# Altium project SecondaryPCB-airbnb.PrjPcb
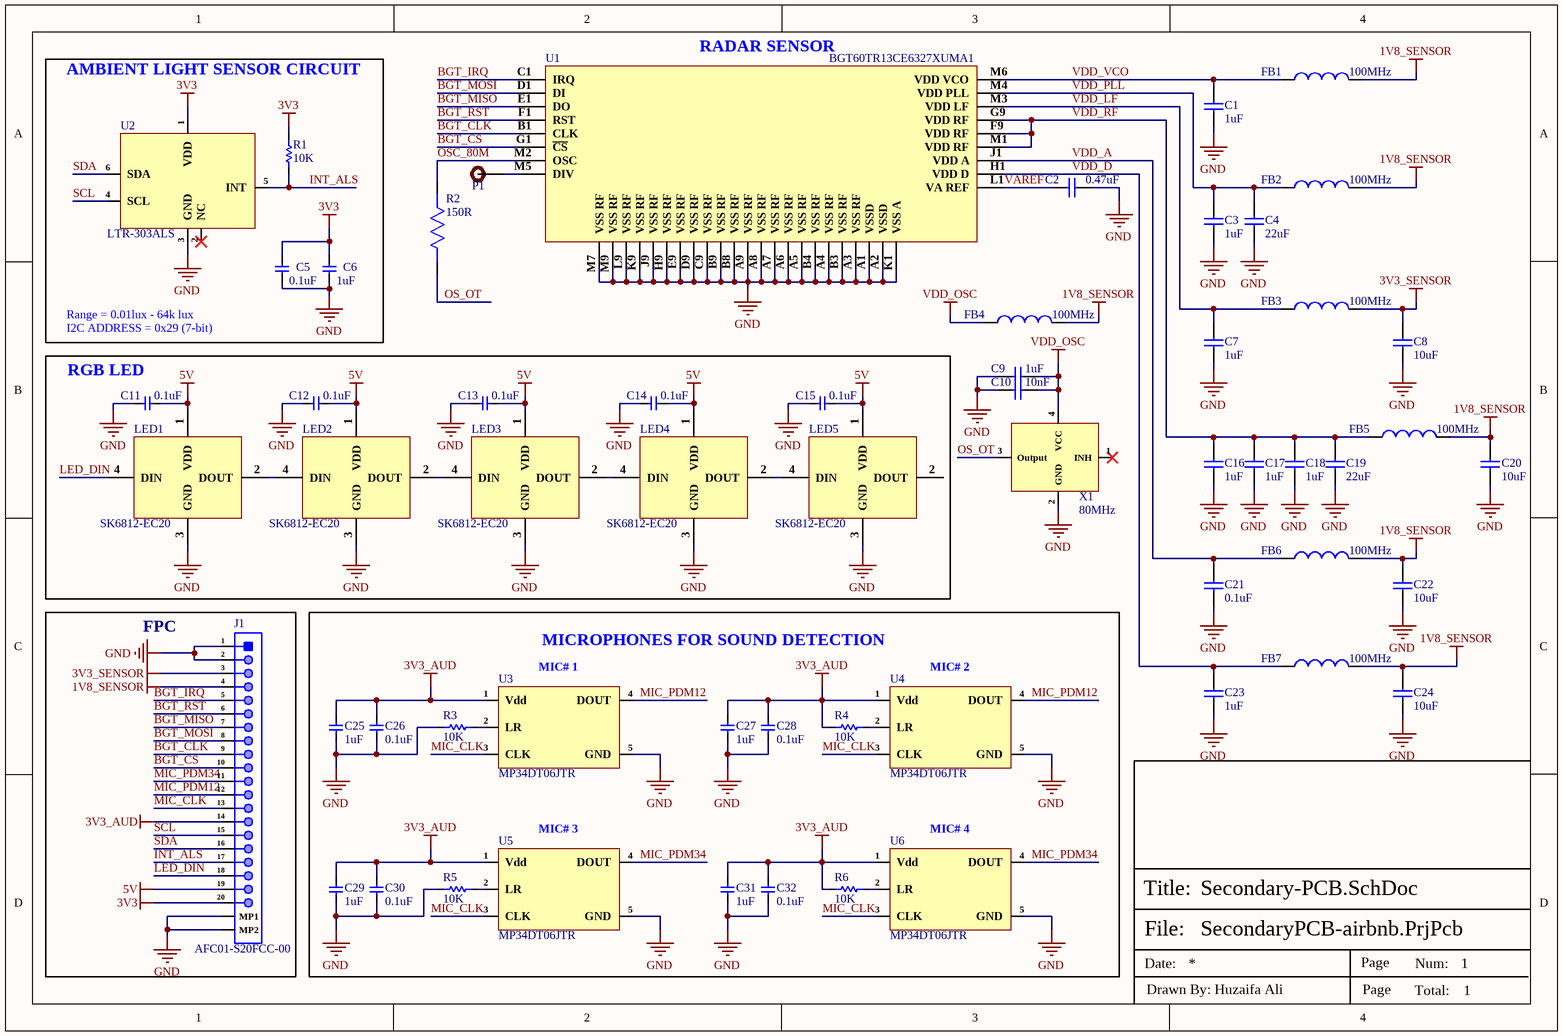
[diagram p0: Secondary-PCB.SchDoc]
1 sheet, 59 parts. Net scope: global (net labels, ports and power ports of the same name join across sheets).
Board file: Secondary-PCB.PcbDoc

## Sheet Secondary-PCB.SchDoc
size A4; SheetNumber: 1; SheetTotal: 1

### Parts
C1  1uF  [Cap-0402]
C2  0.47uF  [Cap-0402]
C3  1uF  [Cap-0402]
C4  22uF  [Cap-0603]
C5  0.1uF  [Cap-0402]
C6  1uF  [Cap-0402]
C7  1uF  [Cap-0402]
C8  10uF  [Cap-0402]
C9  1uF  [Cap-0402]
C10  10nF  [Cap-0402]
C11  0.1uF  [Cap-0402]
C12  0.1uF  [Cap-0402]
C13  0.1uF  [Cap-0402]
C14  0.1uF  [Cap-0402]
C15  0.1uF  [Cap-0402]
C16  1uF  [Cap-0402]
C17  1uF  [Cap-0402]
C18  1uF  [Cap-0402]
C19  22uF  [Cap-0603]
C20  10uF  [Cap-0402]
C21  0.1uF  [Cap-0402]
C22  10uF  [Cap-0402]
C23  1uF  [Cap-0402]
C24  10uF  [Cap-0402]
C25  1uF  [Cap-0402]
C26  0.1uF  [Cap-0402]
C27  1uF  [Cap-0402]
C28  0.1uF  [Cap-0402]
C29  1uF  [Cap-0402]
C30  0.1uF  [Cap-0402]
C31  1uF  [Cap-0402]
C32  0.1uF  [Cap-0402]
FB1  100MHz  [IND-0402]
FB2  100MHz  [IND-0402]
FB3  100MHz  [IND-0402]
FB4  100MHz  [IND-0402]
FB5  100MHz  [IND-0402]
FB6  100MHz  [IND-0402]
FB7  100MHz  [IND-0402]
J1  AFC01-S20FCC-00  [AFC01-S20FCC-00]
LED1  SK6812-EC20  [SK6812-EC20]
LED2  SK6812-EC20  [SK6812-EC20]
LED3  SK6812-EC20  [SK6812-EC20]
LED4  SK6812-EC20  [SK6812-EC20]
LED5  SK6812-EC20  [SK6812-EC20]
P1  TEST POINT  [Test-point]  (value not drawn)
R1  10K  [Res-0603]
R2  150R  [Res-0402]
R3  10K  [Res-0603]
R4  10K  [Res-0603]
R5  10K  [Res-0603]
R6  10K  [Res-0603]
U1  BGT60TR13CE6327XUMA1  [pg-vf2bga-40]
U2  LTR-303ALS  [6-Pin ChipLED]
U3  MP34DT06JTR  [MP34DT06JTR]
U4  MP34DT06JTR  [MP34DT06JTR]
U5  MP34DT06JTR  [MP34DT06JTR]
U6  MP34DT06JTR  [MP34DT06JTR]
X1  80MHz  [KC2016K]

### Blocks framed on the sheet
AMBIENT LIGHT SENSOR CIRCUIT: C5 C6 R1 U2
RGB LED: C11-C15 LED1-LED5
FPC: J1
MICROPHONES FOR SOUND DETECTION: C25-C32 R3-R6 U3-U6

### Nets
1V8_SENSOR: C20.2 C22.2 C24.2 FB1.2 FB2.2 FB4.2 FB5.2 FB6.2 FB7.2 J1.4
3V3: C5.2 C6.2 J1.20 R1.1 U2.1(VDD)
3V3_AUD: C25.2 C26.2 C27.2 C28.2 C29.2 C30.2 C31.2 C32.2 J1.14 R4.2 R6.2 U3.1(Vdd) U4.1(Vdd) U5.1(Vdd) U6.1(Vdd)
3V3_SENSOR: C8.2 FB3.2 J1.3
5V: C11.1 C12.1 C13.1 C14.1 C15.1 J1.19 LED1.1(VDD) LED2.1(VDD) LED3.1(VDD) LED4.1(VDD) LED5.1(VDD)
GND: C1.1 C2.2 C3.1 C4.1 C5.1 C6.1 C7.1 C8.1 C9.2 C10.2 C11.2 C12.2 C13.2 C14.2 C15.2 C16.1 C17.1 C18.1 C19.1 C20.1 C21.1 C22.1 C23.1 C24.1 C25.1 C26.1 C27.1 C28.1 C29.1 C30.1 C31.1 C32.1 J1.1 J1.2 J1.MP1 J1.MP2 LED1.3(GND) LED2.3(GND) LED3.3(GND) LED4.3(GND) LED5.3(GND) R3.2 R5.2 U1.A1(VSSD) U1.A2(VSSD) U1.A3(VSS_RF) U1.A4(VSS_RF) U1.A5(VSS_RF) U1.A6(VSS_RF) U1.A7(VSS_RF) U1.A8(VSS_RF) U1.A9(VSS_RF) U1.B3(VSS_RF) U1.B4(VSS_RF) U1.B8(VSS_RF) U1.B9(VSS_RF) U1.C9(VSS_RF) U1.D9(VSS_RF) U1.E9(VSS_RF) U1.H9(VSS_RF) U1.J9(VSS_RF) U1.K1(VSS_A) U1.K9(VSS_RF) U1.L9(VSS_RF) U1.M7(VSS_RF) U1.M9(VSS_RF) U2.3(GND) U3.5(GND) U4.5(GND) U5.5(GND) U6.5(GND) X1.2(GND)
VDD_OSC: C9.1 C10.1 FB4.1 X1.4(VCC)
BGT_CLK: J1.9 U1.B1(CLK)
BGT_CS: J1.10 U1.G1(~{CS})
BGT_IRQ: J1.5 U1.C1(IRQ)
BGT_MISO: J1.7 U1.E1(DO)
BGT_MOSI: J1.8 U1.D1(DI)
BGT_RST: J1.6 U1.F1(RST)
INT_ALS: J1.17 R1.2 U2.5(INT)
LED_DIN: J1.18 LED1.4(DIN)
MIC_CLK: J1.13 U3.3(CLK) U4.3(CLK) U5.3(CLK) U6.3(CLK)
MIC_PDM12: J1.12 U3.4(DOUT) U4.4(DOUT)
MIC_PDM34: J1.11 U5.4(DOUT) U6.4(DOUT)
OS_OT: R2.2 X1.3(Output)
OSC_80M: R2.1 U1.M2(OSC)
SCL: J1.15 U2.4(SCL)
SDA: J1.16 U2.6(SDA)
VAREF: C2.1 U1.L1(VA_REF)
VDD_A: C21.2 FB6.1 U1.J1(VDD_A)
VDD_D: C23.2 FB7.1 U1.H1(VDD_D)
VDD_LF: C7.2 FB3.1 U1.M3(VDD_LF)
VDD_PLL: C3.2 C4.2 FB2.1 U1.M4(VDD_PLL)
VDD_RF: C16.2 C17.2 C18.2 C19.2 FB5.1 U1.F9(VDD_RF) U1.G9(VDD_RF) U1.M1(VDD_RF)
VDD_VCO: C1.2 FB1.1 U1.M6(VDD_VCO)
NetLED1_2: LED1.2(DOUT) LED2.4(DIN)
NetLED2_2: LED2.2(DOUT) LED3.4(DIN)
NetLED3_2: LED3.2(DOUT) LED4.4(DIN)
NetLED4_2: LED4.2(DOUT) LED5.4(DIN)
NetP1_1: P1.1 U1.M5(DIV)
NetR3_1: R3.1 U3.2(LR)
NetR4_1: R4.1 U4.2(LR)
NetR5_1: R5.1 U5.2(LR)
NetR6_1: R6.1 U6.2(LR)

Not connected (* = marked no-connect by the designer): LED5 2(DOUT); U2 2(NC)*; X1 1(INH)*

### Notes on the sheet
- (near U1) RADAR SENSOR
- Range = 0.01lux - 64k lux
- I2C ADDRESS = 0x29 (7-bit)
- (near U3) MIC# 1
- (near U4) MIC# 2
- (near U5) MIC# 3
- (near U6) MIC# 4
- File:
- Title:
- Date:
- Page
- Num:
- Total:
- Drawn By: Huzaifa Ali

### Library data of the parts
C1 C3 C6 C7 C9 C16-C18 C23 C25 C27 C29 C31 = CC0402KRX5R6BB105: CAP CER 1UF 10V X5R 0402; Manufacturer: Yageo; Tolerance: 10%; Dissipation Factor: 15%; Supplier 1: Mouser; Manufacturer Part Number: CC0402KRX5R6BB105; RoHS: Yes; Category: Ceramic Capacitors; Stock 1: 6711367; Pricing 1: 1=0.11000, 10=0.05500, 50=0.05500, 100=0.03300, 500=0.02700, 1000=0.02200, 2500=0.02100, 10000=0.01800 (USD); Mount: Surface Mount; Case/Package: 0402; Number of Pins: 2; Case Code (Metric): 1005; Case Code (Imperial): 0402; Min Operating Temperature: -55°C; Max Operating Temperature: 85°C; Capacitance: 1uF; Dielectric: X5R; Package Quantity: 1; Voltage Rating: 10V; Packaging: Tape and Reel; Voltage Rating (DC): 10V; Termination: SMD/SMT; Resistor Type: Ceramic; Series: CC; Construction: Flat; Length: 1mm; Width: 0.02inch; Height: 0.5mm; Thickness: 0.022inch; Depth: 0.5mm; Radiation Hardening: No; REACH SVHC: No SVHC; Lead Free: Lead Free; Halogen Free: Halogen Free; RoHS Compliant: Yes; ComponentLink1URL: https://datasheet.ciiva.com/176/upy-gphc-x5r-4v-to-50v-12-176704.pdf?src-supplier=Digi-Key; ComponentLink1Description: https://datasheet.ciiva.com/176/upy-gphc-x5r-4v-to-50v-12-176704.pdf?src-supplier=Digi-Key; ComponentLink2URL: https://datasheet.ciiva.com/176/mlccorderingcode-176705.pdf?src-supplier=Digi-Key; ComponentLink2Description: https://datasheet.ciiva.com/176/mlccorderingcode-176705.pdf?src-supplier=Digi-Key; ComponentLink3URL: https://datasheet.ciiva.com/176/mlccorderingcode-176706.pdf?src-supplier=Digi-Key; ComponentLink3Description: https://datasheet.ciiva.com/176/mlccorderingcode-176706.pdf?src-supplier=Digi-Key; Supplier Part Number 1: 603-CC402KRX5R6BB105; LCSC Part Number: C106254
C2 = UMK105ABJ474KV-F: CAP CER 0.47UF 50V X5R 0402; Manufacturer: Taiyo Yuden; Capacitance: 470nF; Tolerance: 10%; Item Type: Capacitor; Supplier 1: Digi-Key; Manufacturer Part Number: UMK105ABJ474KV-F; RoHS: Yes; Category: Ceramic Capacitors; Stock 1: 145003; Pricing 1: 1=0.24000, 10=0.16100, 50=0.09680, 100=0.08170, 500=0.05592, 1000=0.04946, 2500=0.04731, 5000=0.04301 (USD); Mount: Surface Mount; Case/Package: 0402; Case Code (Metric): 1005; Case Code (Imperial): 0402; Min Operating Temperature: -55°C; Max Operating Temperature: 85°C; Package Quantity: 10000; Packaging: Tape and Reel; Voltage Rating: 50V; Voltage Rating (DC): 50V; Dielectric: X5R; Termination: SMD/SMT; Length: 0.039inch; Width: 0.02inch; Height: 0.5mm; Thickness: 0.022inch; Lead Free: Lead Free; RoHS Compliant: Yes; ComponentLink1URL: https://datasheet.ciiva.com/30249/584umk105abj474kv-f-30249824.pdf?src-supplier=Onlinecomponents.com; ComponentLink1Description: https://datasheet.ciiva.com/30249/584umk105abj474kv-f-30249824.pdf?src-supplier=Onlinecomponents.com; ComponentLink2URL: https://datasheet.ciiva.com/24370/10umk105abj474kv-f-24370678.pdf?src-supplier=Onlinecomponents.com; ComponentLink2Description: https://datasheet.ciiva.com/24370/10umk105abj474kv-f-24370678.pdf?src-supplier=Onlinecomponents.com; ComponentLink3URL: https://datasheet.ciiva.com/18697/mlcc-all-e-18697429.pdf?src-supplier=Digi-Key; ComponentLink3Description: https://datasheet.ciiva.com/18697/mlcc-all-e-18697429.pdf?src-supplier=Digi-Key; ComponentLink4URL: https://datasheet.ciiva.com/18697/mlcc-all-e-18697430.pdf?src-supplier=Digi-Key; ComponentLink4Description: https://datasheet.ciiva.com/18697/mlcc-all-e-18697430.pdf?src-supplier=Digi-Key; ComponentLink5URL: https://datasheet.ciiva.com/18697/mlcc-all-e-18697431.pdf?src-supplier=Digi-Key; ComponentLink5Description: https://datasheet.ciiva.com/18697/mlcc-all-e-18697431.pdf?src-supplier=Digi-Key; Supplier Part Number 1: 587-3497-1-ND; LCSC Part Number: C386109
C4 C19 = CC0603MRX5R6BB226: CAP CER 22UF 10V X5R 0603; Manufacturer: Yageo; Tolerance: 20%; Supplier 1: Digi-Key; Manufacturer Part Number: CC0603MRX5R6BB226; RoHS: Yes; Category: Ceramic Capacitors; Stock 1: 19628; Pricing 1: 1=0.68000, 10=0.48000, 50=0.36300, 100=0.31610, 500=0.23416, 1000=0.19903 (USD); Mount: Surface Mount; Case/Package: 0603; Case Code (Metric): 1608; Case Code (Imperial): 0603; Weight: 7.1E-05oz; Min Operating Temperature: -55°C; Max Operating Temperature: 85°C; Packaging: Tape and Reel; Capacitance: 22uF; Voltage Rating: 10V; Dielectric: X5R; Termination: SMD/SMT; Voltage Rating (DC): 10V; Package Quantity: 4000; Length: 0.063inch; Width: 0.8mm; Height: 0.8mm; Thickness: 0.035inch; Lead Free: Lead Free; Halogen Free: Halogen Free; RoHS Compliant: Yes; ComponentLink1URL: http://www.mouser.com/ds/2/447/Yageo_UPY-GP_NP0_16V-to-50V_9-358835.pdf?src-supplier=Mouser; ComponentLink1Description: http://www.mouser.com/ds/2/447/Yageo_UPY-GP_NP0_16V-to-50V_9-358835.pdf?src-supplier=Mouser; ComponentLink2URL: http://www.yageo.com/documents/recent/UPY-GPHC_X5R_4V-to-50V_25.pdf?src-supplier=Digi-Key; ComponentLink2Description: http://www.yageo.com/documents/recent/UPY-GPHC_X5R_4V-to-50V_25.pdf?src-supplier=Digi-Key; Supplier Part Number 1: 311-1819-1-ND; LCSC Part Number: C109447
C5 C11-C15 = C1005X5R1H104K050BB: CAP CER 0.1UF 50V X5R 0402; Manufacturer: TDK; Dielectric Material: Ceramic; Capacitance: 100nF; Tolerance: 10%; Supplier 1: Digi-Key; Manufacturer Part Number: C1005X5R1H104K050BB; Stock 1: 1455182; Pricing 1: 1=0.12, 10=0.09, 50=0.049, 100=0.04, 500=0.02858, 1000=0.02245, 2500=0.02041, 5000=0.01878 (USD); Mount: Surface Mount; Case/Package: 0402; Case Code (Metric): 1005; Case Code (Imperial): 0402; Weight: 2.3E-05oz; Min Operating Temperature: -55°C; Max Operating Temperature: 85°C; Dielectric: X5R; Voltage Rating: 50V; Packaging: Tape and Reel; Voltage Rating (DC): 50V; Termination: SMD/SMT; Construction: Flat; Package Quantity: 1; Resistor Type: Ceramic; Voltage: 50V; Series: C; Length: 1mm; Width: 0.02inch; Height: 0.5mm; Depth: 0.5mm; Thickness: 0.022inch; Radiation Hardening: No; Lead Free: Lead Free; REACH SVHC: No SVHC; RoHS Compliant: Yes; ComponentLink1URL: https://product.tdk.com/info/en/catalog/spec/mlccspec_commercial_general_midvoltage_en.pdf?src-supplier=Digi-Key; ComponentLink1Description: https://product.tdk.com/info/en/catalog/spec/mlccspec_commercial_general_midvoltage_en.pdf?src-supplier=Digi-Key; ComponentLink2URL: http://www.tdk.co.jp/tefe02/e413_c.pdf?src-supplier=Future+Electronics; ComponentLink2Description: http://www.tdk.co.jp/tefe02/e413_c.pdf?src-supplier=Future+Electronics; ComponentLink3URL: https://www.verical.com/server-webapp/html/getDatasheet?partID=743571&src-supplier=Verical; ComponentLink3Description: https://www.verical.com/server-webapp/html/getDatasheet?partID=743571&src-supplier=Verical; ComponentLink4URL: http://www.tdk.co.jp/tefe02/e412_c.pdf?src-supplier=Avnet+Europe; ComponentLink4Description: http://www.tdk.co.jp/tefe02/e412_c.pdf?src-supplier=Avnet+Europe; Supplier Part Number 1: 445-5942-1-ND; LCSC Part Number: C2181865
C8 C20 C22 C24 = CL05A106MP5NUNC: CAP CER 10UF 10V X5R 0402; Manufacturer: Samsung; Tolerance: 20%; Item Type: Capacitor; Supplier 1: Avnet; Manufacturer Part Number: CL05A106MP5NUNC; RoHS: Yes; Category: Ceramic Capacitors; Stock 1: 1729850; Pricing 1: 10000=0.02537 (USD); Mount: Surface Mount; Case/Package: 0402; Case Code (Metric): 1005; Case Code (Imperial): 0402; Contact Plating: Tin; Min Operating Temperature: -55°C; Max Operating Temperature: 85°C; Package Quantity: 1; Packaging: Tape and Reel; Capacitance: 10uF; Voltage Rating: 10V; Dielectric: X5R; Termination: Wraparound; Series: CL; Construction: Flat; Length: 1mm; Width: 0.02inch; Thickness: 0.028inch; Depth: 0.5mm; Radiation Hardening: No; Lead Free: Lead Free; RoHS Compliant: Yes; ComponentLink1URL: https://datasheet.ciiva.com/25721/cl05a106mp5nunc-25721584.pdf?src-supplier=Digi-Key; ComponentLink1Description: https://datasheet.ciiva.com/25721/cl05a106mp5nunc-25721584.pdf?src-supplier=Digi-Key; ComponentLink2URL: https://datasheet.ciiva.com/26838/getdatasheetpartid-745310-26838170.pdf?src-supplier=Verical; ComponentLink2Description: https://datasheet.ciiva.com/26838/getdatasheetpartid-745310-26838170.pdf?src-supplier=Verical; Supplier Part Number 1: CL05A106MP5NUNC; LCSC Part Number: C315248
C10 = CC0402KRX7R8BB103: CAP CER 10000PF 25V X7R 0402; Manufacturer: Yageo; Tolerance: 10%; Supplier 1: Digi-Key; Manufacturer Part Number: CC0402KRX7R8BB103; Stock 1: 0; Pricing 1: 1=0.1, 10=0.021, 100=0.0093, 500=0.00666, 1000=0.00523, 2500=0.00476, 5000=0.00438 (USD); Mount: Surface Mount; Case/Package: 0402; Case Code (Metric): 1005; Case Code (Imperial): 0402; Min Operating Temperature: -55°C; Max Operating Temperature: 125°C; Capacitance: 10nF; Dielectric: X7R; Voltage Rating: 25V; Package Quantity: 1; Packaging: Tape and Reel; Voltage Rating (DC): 25V; Termination: SMD/SMT; Composition: Ceramic; Length: 1mm; Height: 0.5mm; Depth: 0.5mm; Width: 0.02inch; Thickness: 0.022inch; Radiation Hardening: No; REACH SVHC: Unknown; Lead Free: Lead Free; Halogen Free: Halogen Free; ComponentLink1URL: http://www.yageo.com/documents/recent/UPY-GPHC_X7R_6.3V-to-50V_18.pdf?src-supplier=Digi-Key; ComponentLink1Description: http://www.yageo.com/documents/recent/UPY-GPHC_X7R_6.3V-to-50V_18.pdf?src-supplier=Digi-Key; ComponentLink2URL: https://www.verical.com/server-webapp/html/getDatasheet?partID=375418&src-supplier=Verical; ComponentLink2Description: https://www.verical.com/server-webapp/html/getDatasheet?partID=375418&src-supplier=Verical; ComponentLink3URL: http://www.yageo.com/documents/recent/UPY-GPHC_X7R_6.3V-to-50V_8.pdf?src-supplier=Avnet; ComponentLink3Description: http://www.yageo.com/documents/recent/UPY-GPHC_X7R_6.3V-to-50V_8.pdf?src-supplier=Avnet; ComponentLink4URL: https://4donline.ihs.com/images/VipMasterIC/IC/YAGO/YAGO-S-A0003557223/YAGO-S-A0003557223-1.pdf?hkey=52A5661711E402568146F3353EA87419&src-supplier=Element14; ComponentLink4Description: https://4donline.ihs.com/images/VipMasterIC/IC/YAGO/YAGO-S-A0003557223/YAGO-S-A0003557223-1.pdf?hkey=52A5661711E402568146F3353EA87419&src-supplier=Element14; ComponentLink5URL: http://www.farnell.com/datasheets/2167236.pdf?src-supplier=Element14; ComponentLink5Description: http://www.farnell.com/datasheets/2167236.pdf?src-supplier=Element14; ComponentLink6URL: http://www.mouser.com/ds/2/447/Yageo_UPY-GP_NP0_16V-to-50V_9-358835.pdf?src-supplier=Mouser; ComponentLink6Description: http://www.mouser.com/ds/2/447/Yageo_UPY-GP_NP0_16V-to-50V_9-358835.pdf?src-supplier=Mouser; Supplier Part Number 1: 311-1337-1-ND; LCSC Part Number: C327025
C21 = CL05B104KB54PNC: CAP CER 0.1UF 50V X7R 0402; Manufacturer: Samsung; Supplier 1: Digi-Key; Manufacturer Part Number: CL05B104KB54PNC; Stock 1: 8594; Pricing 1: 1=0.1, 10=0.067, 50=0.0366, 100=0.0299, 500=0.02138, 1000=0.01681, 2500=0.01528, 5000=0.01406 (USD); Supplier Part Number 1: 1276-CL05B104KB54PNCDKR-ND; LCSC Part Number: C307331
C26 C28 C30 C32 = CC0402KRX5R6BB104: CAP CER 0.1UF 10V X5R 0402; Manufacturer: Yageo; Capacitance: 100nF; Tolerance: 10%; Dissipation Factor: 5%; Insulation Resistance: 10GR; Supplier 1: Digi-Key; Manufacturer Part Number: CC0402KRX5R6BB104; RoHS: Yes; Category: Ceramic Capacitors; Stock 1: 6385580; Pricing 1: 1=0.10000, 10=0.02700, 50=0.01500, 100=0.01220, 500=0.00874, 1000=0.00687, 2500=0.00625, 5000=0.00575 (USD); Mount: Surface Mount; Case/Package: 0402; Number of Pins: 2; Case Code (Imperial): 0402; Case Code (Metric): 1005; Min Operating Temperature: -55°C; Max Operating Temperature: 85°C; Dielectric: X5R; Packaging: Tape and Reel; Voltage Rating: 10V; Package Quantity: 1; Termination: SMD/SMT; Voltage Rating (DC): 10V; Series: CC; Length: 1mm; Width: 0.02inch; Height: 0.5mm; Depth: 0.5mm; Thickness: 0.022inch; Radiation Hardening: No; RoHS Compliant: Yes; REACH SVHC: No SVHC; Lead Free: Lead Free; Halogen Free: Halogen Free; ComponentLink1URL: https://datasheet.ciiva.com/144/mlccorderingcode-144029.pdf?src-supplier=Digi-Key; ComponentLink1Description: https://datasheet.ciiva.com/144/mlccorderingcode-144029.pdf?src-supplier=Digi-Key; ComponentLink2URL: https://datasheet.ciiva.com/144/mlccorderingcode-144028.pdf?src-supplier=Digi-Key; ComponentLink2Description: https://datasheet.ciiva.com/144/mlccorderingcode-144028.pdf?src-supplier=Digi-Key; ComponentLink3URL: https://datasheet.ciiva.com/144/mlccorderingcode-144030.pdf?src-supplier=Digi-Key; ComponentLink3Description: https://datasheet.ciiva.com/144/mlccorderingcode-144030.pdf?src-supplier=Digi-Key; ComponentLink4URL: https://datasheet.ciiva.com/7978/1359354-7978091.pdf?src-supplier=Element14; ComponentLink4Description: https://datasheet.ciiva.com/7978/1359354-7978091.pdf?src-supplier=Element14; ComponentLink5URL: https://datasheet.ciiva.com/11587/upy-gphc-x5r-4v-to-50v-12-11587302.pdf?src-supplier=Avnet; ComponentLink5Description: https://datasheet.ciiva.com/11587/upy-gphc-x5r-4v-to-50v-12-11587302.pdf?src-supplier=Avnet; Supplier Part Number 1: 311-1336-1-ND; LCSC Part Number: C129131
FB1-FB7 = BLM15PD121SN1D: FERRITE BEAD 120 OHM 0402 1LN; Manufacturer: Murata; Material: Steel,Ferrite; Tolerance: 25%; Impedance: 120R; Current Rating: 1.3A; Number of Lines: 1; DC Resistance (DCR): 90mR; Supplier 1: Avnet; Manufacturer Part Number: BLM15PD121SN1D; RoHS: Yes; Category: Ferrite Beads and Chips; Stock 1: 300000; Pricing 1: 10000=0.03238, 20000=0.03063, 40000=0.02888, 60000=0.02713, 80000=0.02538, 100000=0.02363, 1000000=0.02188 (USD); Case/Package: 0402; Number of Pins: 2; Core Material: Ferrite; Case Code (Metric): 1005; Case Code (Imperial): 0402; Min Operating Temperature: -55°C; Max Operating Temperature: 125°C; Package Quantity: 1; Packaging: Tape and Reel; Max Current Rating: 1.3A; Termination: SMD/SMT; Max DC Current: 1.3A; Test Frequency: 100MHz; DC Current: 1.3A; Number of Circuits: 1; Series: BLM15PD; DC Resistance-Max: 90mR; Length: 1mm; Width: 0.5mm; Height: 0.5mm; Depth: 0.55mm; Radiation Hardening: No; Reach SVHC Compliant: Yes; Military Standard: Not; Lead Free: Lead Free; RoHS Compliant: Yes; ComponentLink1URL: https://datasheet.ciiva.com/11800/0900766b811b5866-11800860.pdf?src-supplier=RSComponents; ComponentLink1Description: https://datasheet.ciiva.com/11800/0900766b811b5866-11800860.pdf?src-supplier=RSComponents; ComponentLink2URL: https://datasheet.ciiva.com/18093/getdatasheetpartid-195858-18093157.pdf?src-supplier=Verical; ComponentLink2Description: https://datasheet.ciiva.com/18093/getdatasheetpartid-195858-18093157.pdf?src-supplier=Verical; ComponentLink3URL: https://datasheet.ciiva.com/41425/001171686-da-01-en-chip-drossel0402-120r-1300ma-1-0x0-5mm-41425776.pdf?src-supplier=Conrad; ComponentLink3Description: https://datasheet.ciiva.com/41425/001171686-da-01-en-chip-drossel0402-120r-1300ma-1-0x0-5mm-41425776.pdf?src-supplier=Conrad; ComponentLink4URL: https://datasheet.ciiva.com/41449/001172205-da-01-en-drossel-0402-120r-11-0x0-5mm-10000st-41449495.pdf?src-supplier=Conrad; ComponentLink4Description: https://datasheet.ciiva.com/41449/001172205-da-01-en-drossel-0402-120r-11-0x0-5mm-10000st-41449495.pdf?src-supplier=Conrad; ComponentLink5URL: https://datasheet.ciiva.com/1012/l0110e-1012435.pdf?src-supplier=Digi-Key; ComponentLink5Description: https://datasheet.ciiva.com/1012/l0110e-1012435.pdf?src-supplier=Digi-Key; ComponentLink6URL: https://datasheet.ciiva.com/1012/l0110e-1012434.pdf?src-supplier=Digi-Key; ComponentLink6Description: https://datasheet.ciiva.com/1012/l0110e-1012434.pdf?src-supplier=Digi-Key; ComponentLink7URL: https://datasheet.ciiva.com/1012/l0110e-1012436.pdf?src-supplier=Digi-Key; ComponentLink7Description: https://datasheet.ciiva.com/1012/l0110e-1012436.pdf?src-supplier=Digi-Key; Supplier Part Number 1: BLM15PD121SN1D; LCSC Part Number: C76891; Item Type: Ferrite Bead
J1 = AFC01-S20FCC-00: Clamshell 20P Bottom Contact Surface Mount 0.5mm SMD,P=0.5mm FFC/FPC Connectors ROHS; Manufacturer: JUSHUO; Manufacturer Part Number: AFC01-S20FCC-00; Package: SMD,P=0.5mm; LCSC Part Number: C262274; ComponentLink1Description: LCSC; ComponentLink1URL: https://www.lcsc.com/product-detail/FFC-FPC-Connectors_JUSHUO-AFC01-S20FCC-00_C262274.html; Item Type: FPC Connector
LED1-LED5 = SK6812-EC20: 5mA -40℃~+80℃ RGB SMD,2x2mm Light Emitting Diodes (LED) ROHS; Manufacturer: OPSCO Optoelectronics; Item Type: RGB LED; Manufacturer Part Number: SK6812-EC20; Package: SMD,2x2mm; LCSC Part Number: C2909058; ComponentLink1Description: LCSC; ComponentLink1URL: https://www.lcsc.com/product-detail/Light-Emitting-Diodes-LED_OPSCO-Optoelectronics-SK6812-EC20_C2909058.html
P1 = TEST POINT: Test Point ON; Item Type: TEST POINT
R1 R3-R6 = RC0603FR-0710KL: RES SMD 10K Ohm 1% 1/10W 0603; Manufacturer: Yageo; Resistance: 10kR; Temperature Coefficient: 100ppm/°C; Voltage Rating (DC): 50V; Power Rating: 100mW; Voltage Rating: 75V; Item Type: Resistor; Supplier 1: Digi-Key; Manufacturer Part Number: RC0603FR-0710KL; RoHS: Yes; Category: Chip SMD Resistors; Stock 1: 25249139; Pricing 1: 1=0.10000, 10=0.02400, 100=0.00970, 1000=0.00436, 2500=0.00378 (USD); Case/Package: 0603; Number of Pins: 2; Case Code (Imperial): 0603; Case Code (Metric): 1608; Weight: 7.1E-05oz; Size Code: 0603; Min Operating Temperature: -55°C; Max Operating Temperature: 155°C; Tolerance: 1%; Resistor Type: Thick Film; Packaging: Tape and Reel; Termination: SMD/SMT; Features: Moisture Resistant; Series: RC; Max Power Dissipation: 100mW; Number of Terminations: 2; Resistance Tolerance: 1%; Construction: Rectangular; Length: 1.6mm; Width: 0.8mm; Height: 0.45mm; Depth: 0.8mm; Lead Pitch: 0.3mm; REACH SVHC: Unknown; Lead Free: Lead Free; Military Standard: Not; RoHS Compliant: Yes; ComponentLink1URL: https://datasheet.ciiva.com/7660/38590-7660789.pdf?src-supplier=Element14; ComponentLink1Description: https://datasheet.ciiva.com/7660/38590-7660789.pdf?src-supplier=Element14; ComponentLink2URL: https://datasheet.ciiva.com/7983/443971-7983596.pdf?src-supplier=Element14; ComponentLink2Description: https://datasheet.ciiva.com/7983/443971-7983596.pdf?src-supplier=Element14; ComponentLink3URL: https://datasheet.ciiva.com/22747/443971-22747519.pdf?src-supplier=Element14; ComponentLink3Description: https://datasheet.ciiva.com/22747/443971-22747519.pdf?src-supplier=Element14; ComponentLink4URL: https://datasheet.ciiva.com/46440/1868787-46440891.pdf?src-supplier=Element14; ComponentLink4Description: https://datasheet.ciiva.com/46440/1868787-46440891.pdf?src-supplier=Element14; ComponentLink5URL: https://datasheet.ciiva.com/7746/1738695-7746239.pdf?src-supplier=Element14; ComponentLink5Description: https://datasheet.ciiva.com/7746/1738695-7746239.pdf?src-supplier=Element14; ComponentLink6URL: https://datasheet.ciiva.com/15189/getdatasheetpartid-409289-15189591.pdf?src-supplier=Verical; ComponentLink6Description: https://datasheet.ciiva.com/15189/getdatasheetpartid-409289-15189591.pdf?src-supplier=Verical; Supplier Part Number 1: 311-10.0KHRCT-ND; LCSC Part Number: C98220
R2 = ERJ-2GEJ151X: RES SMD 150 OHM 5% 1/10W 0402; Manufacturer: Panasonic; Power Rating: 100mW; Voltage Rating: 50V; Temperature Coefficient: 200ppm/°C; Item Type: Resistor; Supplier 1: Avnet; Manufacturer Part Number: ERJ-2GEJ151X; RoHS: Yes; Category: Chip SMD Resistors; Stock 1: 19191; Pricing 1: 1=0.10100, 25=0.03200, 100=0.01300, 250=0.01100, 500=0.00900, 1000=0.00500 (USD); Mount: Surface Mount; Case/Package: 0402; Case Code (Imperial): 0402; Case Code (Metric): 1005; Weight: 2.8E-05oz; Contact Plating: Tin; Min Operating Temperature: -55°C; Max Operating Temperature: 155°C; Resistance: 150R; Tolerance: 5%; Packaging: Tape and Reel; Package Quantity: 10000; Resistor Type: Thick Film; Termination: SMD/SMT; Number of Terminations: 2; Max Power Dissipation: 100mW; Voltage Rating (DC): 50V; Working Voltage: 50V; Features: Automotive AEC-Q200; Series: ERJ; Technology: THICK FILM; Construction: Rectangular; Resistance Tolerance: 5%; Length: 1mm; Width: 0.5mm; Height: 0.35mm; Depth: 0.5mm; Ratings: AEC-Q200; Radiation Hardening: No; Reach SVHC Compliant: Yes; Military Standard: Not; Lead Free: Lead Free; RoHS Compliant: Yes; ComponentLink1URL: https://datasheet.ciiva.com/11821/0900766b80f806dd-11821182.pdf?src-supplier=RSComponents; ComponentLink1Description: https://datasheet.ciiva.com/11821/0900766b80f806dd-11821182.pdf?src-supplier=RSComponents; ComponentLink2URL: https://datasheet.ciiva.com/43460/1500035-43460367.pdf?src-supplier=Farnell; ComponentLink2Description: https://datasheet.ciiva.com/43460/1500035-43460367.pdf?src-supplier=Farnell; ComponentLink3URL: https://datasheet.ciiva.com/6082/1500035-6082105.pdf?src-supplier=Farnell; ComponentLink3Description: https://datasheet.ciiva.com/6082/1500035-6082105.pdf?src-supplier=Farnell; ComponentLink4URL: https://datasheet.ciiva.com/46377/1500035-46377070.pdf?src-supplier=Element14; ComponentLink4Description: https://datasheet.ciiva.com/46377/1500035-46377070.pdf?src-supplier=Element14; ComponentLink5URL: https://datasheet.ciiva.com/28568/1678796-28568939.pdf?src-supplier=Element14; ComponentLink5Description: https://datasheet.ciiva.com/28568/1678796-28568939.pdf?src-supplier=Element14; ComponentLink6URL: https://datasheet.ciiva.com/16773/70260739-16773454.pdf?src-supplier=Allied+Electronics; ComponentLink6Description: https://datasheet.ciiva.com/16773/70260739-16773454.pdf?src-supplier=Allied+Electronics; ComponentLink7URL: https://datasheet.ciiva.com/30178/4aoa0000ce1-30178453.pdf?src-supplier=Onlinecomponents.com; ComponentLink7Description: https://datasheet.ciiva.com/30178/4aoa0000ce1-30178453.pdf?src-supplier=Onlinecomponents.com; Supplier Part Number 1: 65T8254; LCSC Part Number: C412976
U1 = BGT60TR13CE6327XUMA1: Rf Transceiver PG-VF2BGA-40; Manufacturer: Infineon; Item Type: IC; Supplier 1: Newark; Manufacturer Part Number: BGT60TR13CE6327XUMA1; RoHS: No; Category: RF Receivers, Transceivers; Stock 1: 4397; Pricing 1: 1=20.67000, 10=18.89000, 25=17.50000, 50=16.72000, 100=15.93000, 250=15.16000, 500=14.94000, 1000=14.51000 (USD); Supplier Part Number 1: 25AK0242; LCSC Part Number: C3606641; ComponentLink1Description: LCSC; ComponentLink1URL: https://www.lcsc.com/product-detail/RF-Transceiver-ICs_Infineon-Technologies-BGT60TR13CE6327XUMA1_C3606641.html
U2 = LTR-303ALS-01: SENSOR OPT AMBIENT 6DFN; Manufacturer: Vishay Lite-On; Output Type: I2C; Item Type: Ambient Light Sensor; Supplier 1: Arrow Electronics; Manufacturer Part Number: LTR-303ALS-01; RoHS: Yes; Category: Uncategorized; Stock 1: 1717; Pricing 1: 1=0.5742, 10=0.465, 25=0.4604, 100=0.394, 250=0.39, 500=0.3741, 1000=0.3355 (USD); Mounting Technology: Surface Mount; Case/Package: DFN; Pins: 6; Min Operating Temperature: -30°C; Max Operating Temperature: 70°C; Packaging: Cut Tape; Series: -; RoHS Compliant: Yes; ComponentLink1URL: http://optoelectronics.liteon.com/upload/download/DS86-2013-0004/LTR-303ALS-01_DS_V1.pdf?src-supplier=Digi-Key; ComponentLink1Description: http://optoelectronics.liteon.com/upload/download/DS86-2013-0004/LTR-303ALS-01_DS_V1.pdf?src-supplier=Digi-Key; ComponentLink2URL: http://optoelectronics.liteon.com/upload/download/DS86-2013-0004/P_100_LTR-303ALS-01%20DS.pdf?src-supplier=Avnet; ComponentLink2Description: http://optoelectronics.liteon.com/upload/download/DS86-2013-0004/P_100_LTR-303ALS-01%20DS.pdf?src-supplier=Avnet; Supplier Part Number 1: LTR-303ALS-01; LCSC Part Number: C364577
U3-U6 = MP34DT06JTR: MIC MEMS DIGITAL PDM OMNI -26DB; Manufacturer: STMicroelectronics; Shape: Rectangular; Direction: Omnidirectional; Voltage Rating: 1.8V; Operating Supply Current: 650uA; Item Type: Microphone; Supplier 1: Mouser; Manufacturer Part Number: MP34DT06JTR; RoHS: Yes; Category: Microphones; Stock 1: 6064; Pricing 1: 1=2.31, 10=1.92, 50=1.6, 100=1.51, 1000=1.24, 10000=1.23 (USD); Packaging: Cut Tape; Termination: Solder; Series: -; RoHS Compliant: Yes; ComponentLink1URL: http://www.farnell.com/datasheets/2710895.pdf?src-supplier=Farnell; ComponentLink1Description: http://www.farnell.com/datasheets/2710895.pdf?src-supplier=Farnell; ComponentLink2URL: https://www.st.com/resource/en/datasheet/mp34dt06j.pdf?src-supplier=Digi-Key; ComponentLink2Description: https://www.st.com/resource/en/datasheet/mp34dt06j.pdf?src-supplier=Digi-Key; ComponentLink3URL: http://www.farnell.com/datasheets/2710895.pdf?src-supplier=Newark; ComponentLink3Description: http://www.farnell.com/datasheets/2710895.pdf?src-supplier=Newark; ComponentLink4URL: http://www.farnell.com/datasheets/2710895.pdf?src-supplier=Element14; ComponentLink4Description: http://www.farnell.com/datasheets/2710895.pdf?src-supplier=Element14; Supplier Part Number 1: 511-MP34DT06JTR; LCSC Part Number: C503097
X1 = KC2016K80.0000C1GE00: XTAL OSC XO 80.0000MHZ CMOS SMD; Manufacturer: Kyocera AVX; Max Supply Current: 8mA; Frequency Stability: 50ppm; Item Type: Crystal; Supplier 1: Digi-Key; Manufacturer Part Number: KC2016K80.0000C1GE00; RoHS: Yes; Category: Oscillators; Stock 1: 350; Pricing 1: 1=1.31000, 10=1.25300, 50=1.22440, 100=1.04940, 500=1.02024, 1000=0.85992 (USD); Mount: Surface Mount; Case/Package: SMD/SMT; Min Operating Temperature: -40°C; Max Operating Temperature: 85°C; Packaging: Tape and Reel; Frequency: 80MHz; Length: 0.079inch; Width: 0.063inch; Height: 0.031inch; Lead Free: Lead Free; RoHS Compliant: No; ComponentLink1URL: http://www.mouser.com/ds/2/40/clock_k_e-522534.pdf?src-supplier=Mouser; ComponentLink1Description: http://www.mouser.com/ds/2/40/clock_k_e-522534.pdf?src-supplier=Mouser; ComponentLink2URL: http://www.kyocera-crystal.jp/eng/wp-content/uploads/2014/09/pkg_e.pdf?src-supplier=Digi-Key; ComponentLink2Description: http://www.kyocera-crystal.jp/eng/wp-content/uploads/2014/09/pkg_e.pdf?src-supplier=Digi-Key; ComponentLink3URL: http://global.kyocera.com/prdct/electro/product/pdf/clock_k_e.pdf?src-supplier=Digi-Key; ComponentLink3Description: http://global.kyocera.com/prdct/electro/product/pdf/clock_k_e.pdf?src-supplier=Digi-Key; Supplier Part Number 1: 478-KC2016K80.0000C1GE00CT-ND; LCSC Part Number: C1988243